# Altium schematic sheet JIG_TEST_FLEX_V1.0.SchDoc
size A2; SheetNumber: 1; SheetTotal: 1
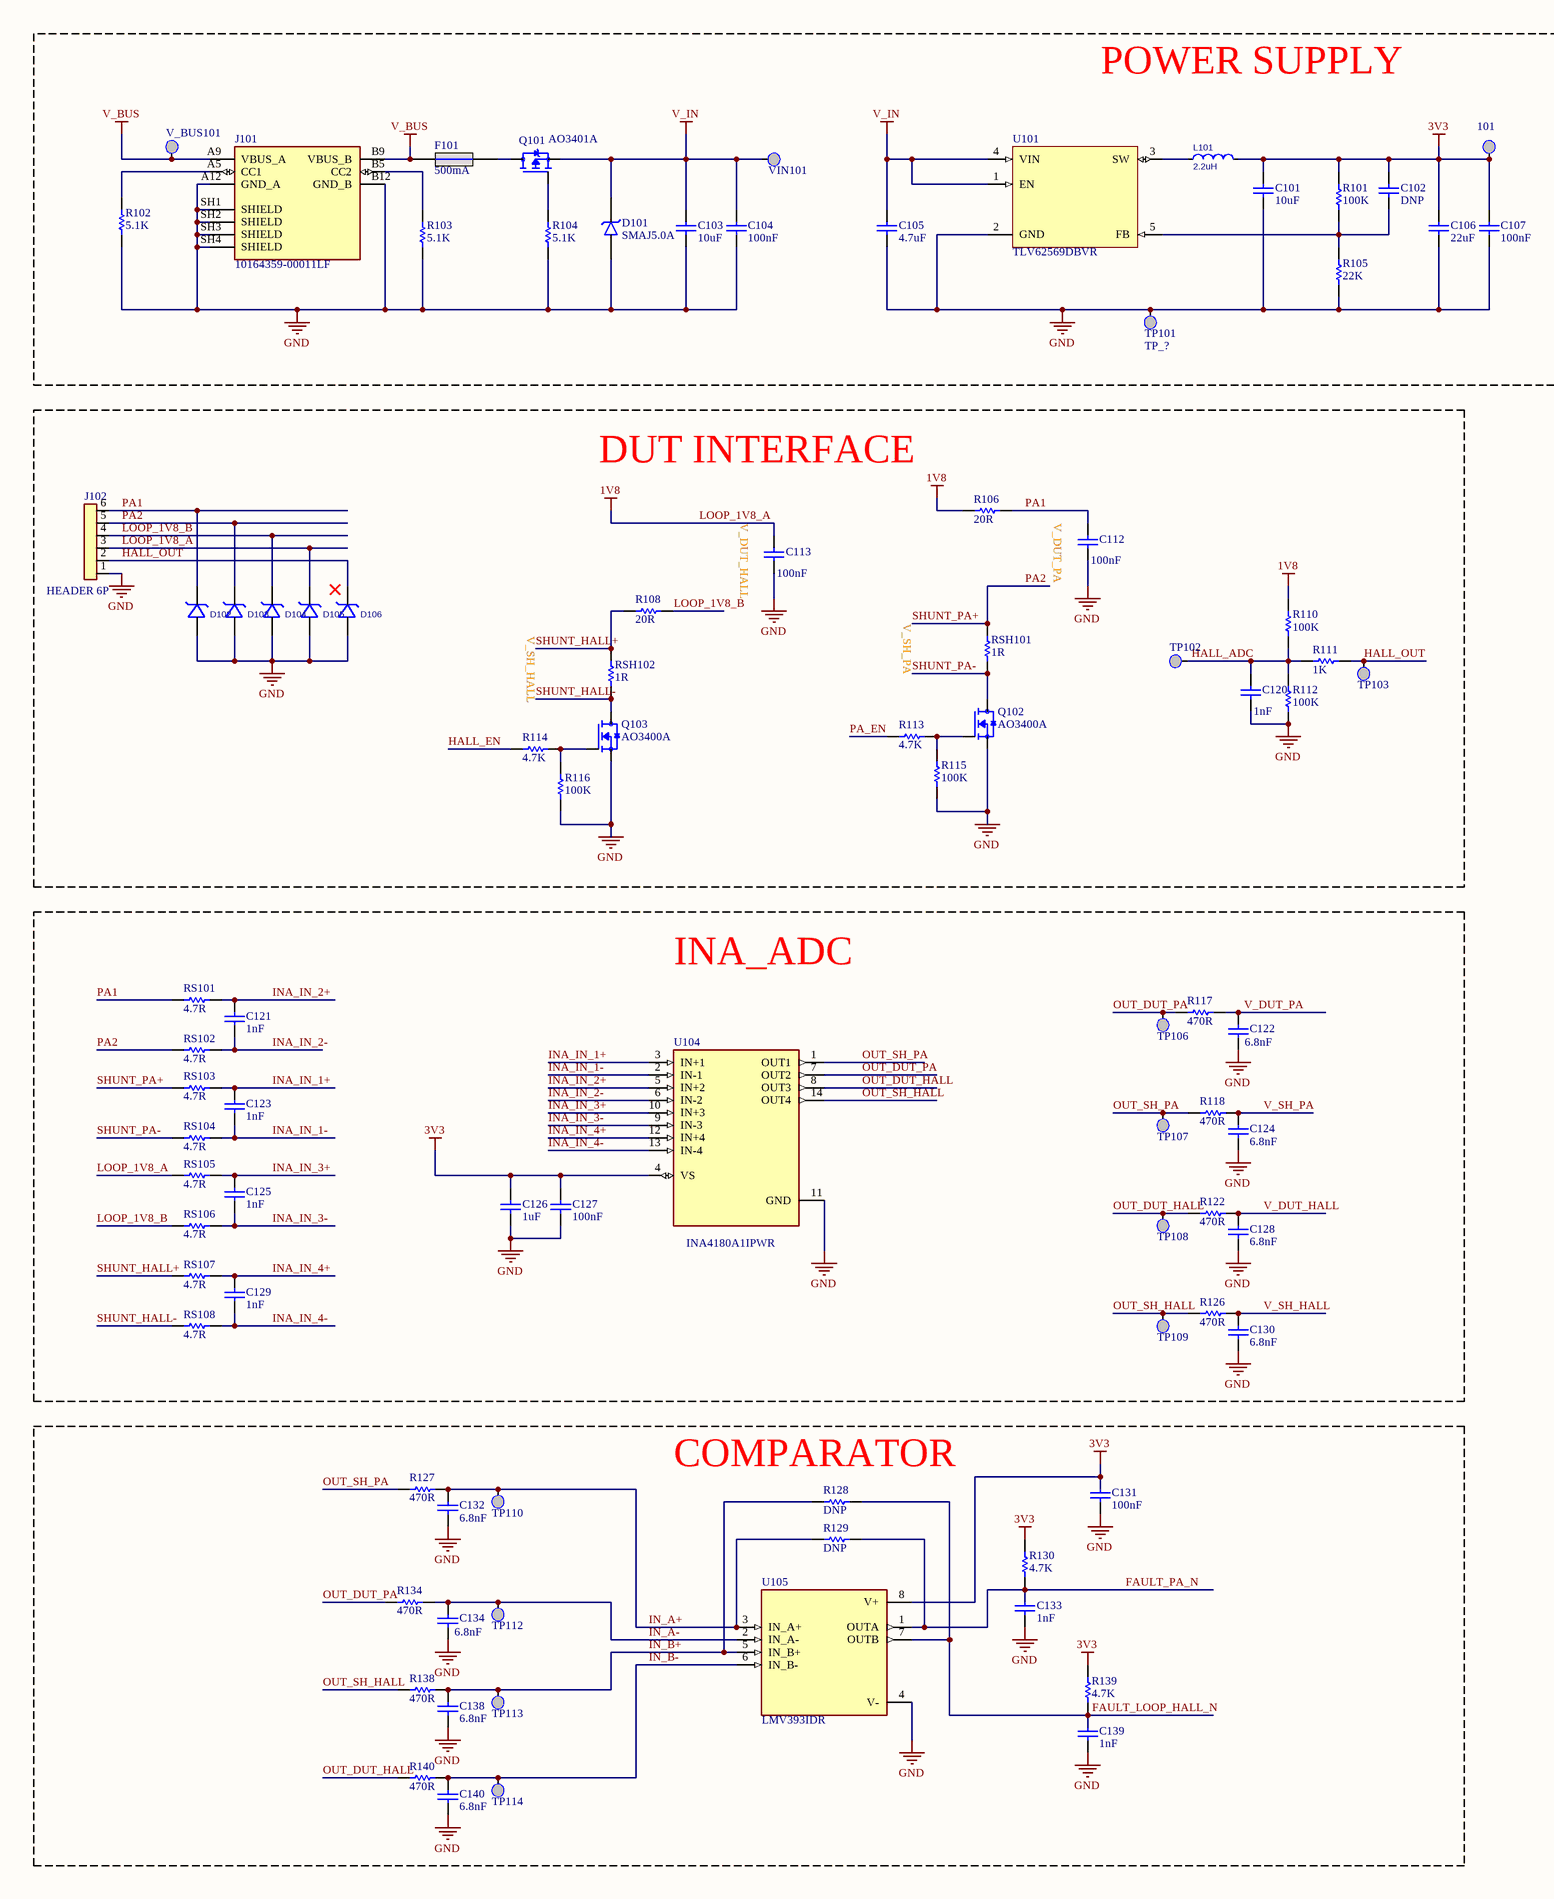
[diagram p0: JIG_TEST_FLEX_V1.0.SchDoc, left]
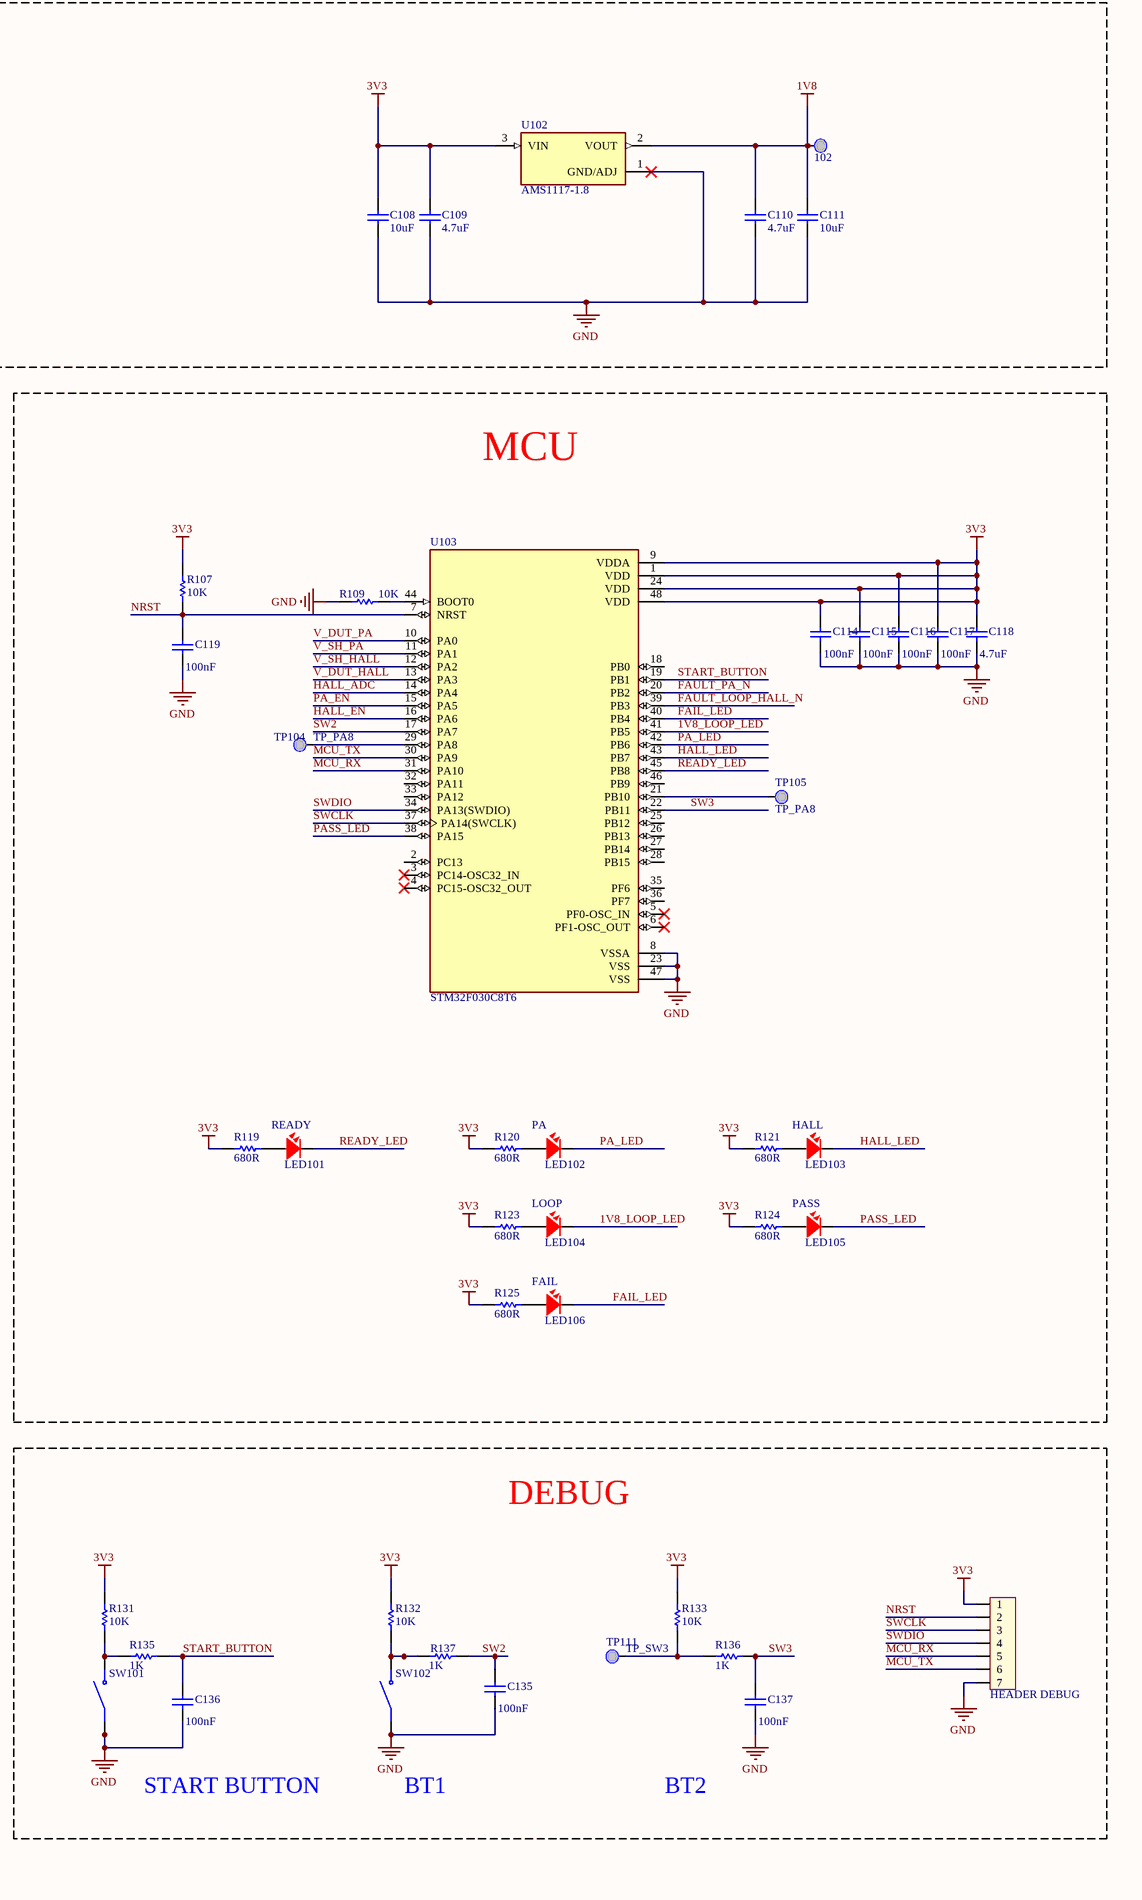
[diagram p1: JIG_TEST_FLEX_V1.0.SchDoc, right]

## Parts
101  TP_?  [TP_SMD_1P50]  (value not drawn)
102  TP_?  [TP_SMD_1P50]  (value not drawn)
C101  10uF  [C0603L]
C102  DNP  [C0402L]
C103  10uF  [C0603L]
C104  100nF  [C0402L]
C105  4.7uF  [C0603L]
C106  22uF  [C0603L]
C107  100nF  [C0402L]
C108  10uF  [C0603L]
C109  4.7uF  [C0603L]
C110  4.7uF  [C0603L]
C111  10uF  [C0603L]
C112  100nF  [C0402L]
C113  100nF  [C0402L]
C114  100nF  [C0402L]
C115  100nF  [C0402L]
C116  100nF  [C0402L]
C117  100nF  [C0402L]
C118  4.7uF  [C0603L]
C119  100nF  [C0402L]
C120  1nF  [C0402L]
C121  1nF  [C0402L]
C122  6.8nF  [C0402L]
C123  1nF  [C0402L]
C124  6.8nF  [C0402L]
C125  1nF  [C0402L]
C126  1uF  [C0402L]
C127  100nF  [C0402L]
C128  6.8nF  [C0402L]
C129  1nF  [C0402L]
C130  6.8nF  [C0402L]
C131  100nF  [C0402L]
C132  6.8nF  [C0402L]
C133  1nF  [C0402L]
C134  6.8nF  [C0402L]
C135  100nF  [C0402L]
C136  100nF  [C0402L]
C137  100nF  [C0402L]
C138  6.8nF  [C0402L]
C139  1nF  [C0402L]
C140  6.8nF  [C0402L]
D101  SMAJ5.0A  [DIOM5026X229N]
D102  PESD5V0U1UA  [SOD-323_L1.8-W1.3-LS2.5-RD]  (value not drawn)
D103  PESD5V0U1UA  [SOD-323_L1.8-W1.3-LS2.5-RD]  (value not drawn)
D104  PESD5V0U1UA  [SOD-323_L1.8-W1.3-LS2.5-RD]  (value not drawn)
D105  PESD5V0U1UA  [SOD-323_L1.8-W1.3-LS2.5-RD]  (value not drawn)
D106  PESD5V0U1UA  [SOD-323_L1.8-W1.3-LS2.5-RD]  (value not drawn)
F101  Value1: 500mA  [R1206Z]  (hidden comment: PTC 500mA 6V)
H101  HEADER DEBUG  [HDR_1X07_P2.54_D1.10]
J101  10164359-00011LF  [AMPHENOL_10164359-00011LF]
J102  HEADER 6P  [61300611121]
L101  2.2uH  [IND-SMD_L4.1-W4.1_PSPMAA0402-1]
LED101  READY  [LED0603_RED]
LED102  PA  [LED0603_RED]
LED103  HALL  [LED0603_RED]
LED104  LOOP  [LED0603_RED]
LED105  PASS  [LED0603_RED]
LED106  FAIL  [LED0603_RED]
Q101  AO3401A  [SOT23-3]
Q102  AO3400A  [SOT95P280X125-3N]
Q103  AO3400A  [SOT95P280X125-3N]
R101  100K  [R0402L1]
R102  5.1K  [R0402L1]
R103  5.1K  [R0402L1]
R104  5.1K  [R0402L1]
R105  22K  [R0402L1]
R106  20R  [R0805]
R107  10K  [R0402L1]
R108  20R  [R0805]
R109  10K  [R0402L1]
R110  100K  [R0402L1]
R111  1K  [R0402L1]
R112  100K  [R0402L1]
R113  4.7K  [R0402L1]
R114  4.7K  [R0402L1]
R115  100K  [R0402L1]
R116  100K  [R0402L1]
R117  470R  [R0402L1]
R118  470R  [R0402L1]
R119  680R  [R0603L]
R120  680R  [R0603L]
R121  680R  [R0603L]
R122  470R  [R0402L1]
R123  680R  [R0603L]
R124  680R  [R0603L]
R125  680R  [R0603L]
R126  470R  [R0402L1]
R127  470R  [R0402L1]
R128  DNP  [R0402L1]
R129  DNP  [R0402L1]
R130  4.7K  [R0402L1]
R131  10K  [R0402L1]
R132  10K  [R0402L1]
R133  10K  [R0402L1]
R134  470R  [R0402L1]
R135  1K  [R0402L1]
R136  1K  [R0402L1]
R137  1K  [R0402L1]
R138  470R  [R0402L1]
R139  4.7K  [R0402L1]
R140  470R  [R0402L1]
RS101  4.7R  [R0603L]
RS102  4.7R  [R0603L]
RS103  4.7R  [R0603L]
RS104  4.7R  [R0603L]
RS105  4.7R  [R0603L]
RS106  4.7R  [R0603L]
RS107  4.7R  [R0603L]
RS108  4.7R  [R0603L]
RSH101  1R  [R1206Z]
RSH102  1R  [R1206Z]
SW101  TS-1187A-B-A-B  [SW_TS-1187A-B-A-B]  (value not drawn)
SW102  TS-1187A-B-A-B  [SW_TS-1187A-B-A-B]  (value not drawn)
TP101  TP_?  [TP_SMD_1P50]
TP102  (no value)  [TP_SMD_1P50]
TP103  (no value)  [TP_SMD_1P50]
TP104  TP_PA8  [TP_SMD_1P50]
TP105  TP_PA8  [TP_SMD_1P50]
TP106  (no value)  [TP_SMD_1P50]
TP107  (no value)  [TP_SMD_1P50]
TP108  (no value)  [TP_SMD_1P50]
TP109  (no value)  [TP_SMD_1P50]
TP110  (no value)  [TP_SMD_1P50]
TP111  TP_SW3  [TP_SMD_1P50]
TP112  (no value)  [TP_SMD_1P50]
TP113  (no value)  [TP_SMD_1P50]
TP114  (no value)  [TP_SMD_1P50]
U101  TLV62569DBVR  [SOT95P280X145-5N]
U102  AMS1117-1.8  [SOT229P700X180-4N]
U103  STM32F030C8T6  [QFP50P900X900X160-48N]
U104  INA4180A1IPWR  [SOP65P640X120-14N]
U105  LMV393IDR  [SOIC127P599X175-8N]
V_BUS101  TP_?  [TP_SMD_1P50]  (value not drawn)
VIN101  TP_?  [TP_SMD_1P50]  (value not drawn)

## Blocks framed on the sheet
POWER SUPPLY: 101 102 C101-C111 D101 F101 J101 L101 Q101 R101-R105 TP101 U101 U102 V_BUS101 VIN101
DUT INTERFACE: C112 C113 C120 D102-D106 J102 Q102 Q103 R106 R108 R110-R116 RSH101 RSH102 TP102 TP103
MCU: C114-C119 LED101-LED106 R107 R109 R119-R121 R123-R125 TP104 TP105 U103
INA_ADC: C121-C130 R117 R118 R122 R126 RS101-RS108 TP106-TP109 U104
COMPARATOR: C131-C134 C138-C140 R127-R130 R134 R138-R140 TP110 TP112-TP114 U105
DEBUG: C135-C137 H101 R131-R133 R135-R137 SW101 SW102 TP111

## Nets
3V3: 101.1(TP) C101.1 C102.1 C106.1 C107.1 C108.1 C109.1 C114.1 C115.1 C116.1 C117.1 C118.1 C126.1 C127.1 C131.1 H101.1 L101.2 R101.1 R107.1 R119.1 R120.1 R121.1 R123.1 R124.1 R125.1 R130.1 R131.1 R132.1 R133.1 R139.1 U102.3(VIN) U103.1(VDD) U103.9(VDDA) U103.24(VDD) U103.48(VDD) U104.4(VS) U105.8(V+)
GND: C101.2 C103.2 C104.2 C105.2 C106.2 C107.2 C108.2 C109.2 C110.2 C111.2 C112.2 C113.2 C114.2 C115.2 C116.2 C117.2 C118.2 C119.2 C120.2 C122.2 C124.2 C126.2 C127.2 C128.2 C130.2 C131.2 C132.2 C133.2 C134.2 C135.2 C136.2 C137.2 C138.2 C139.2 C140.2 D101.2(A) D102.2(A) D103.2(A) D104.2(A) D105.2(A) D106.2(A) H101.7 J101.A12(GND_A) J101.B12(GND_B) J101.SH1(SHIELD) J101.SH2(SHIELD) J101.SH3(SHIELD) J101.SH4(SHIELD) J102.1 Q102.2(S) Q103.2(S) R102.2 R103.2 R104.2 R105.2 R109.1 R112.2 R115.2 R116.2 SW101.A(COM) SW101.B(COM) SW102.A(COM) SW102.B(COM) TP101.1(TP) U101.2(GND) U102.1(GND/ADJ) U103.8(VSSA) U103.23(VSS) U103.47(VSS) U104.11(GND) U105.4(V-)
LOOP_1V8_A: 102.1(TP) C110.1 C111.1 C113.1 D105.1(C) J102.3 R106.1 R110.1 RS105.2 U102.2(VOUT)  [also labelled 1V8]
V_BUS: F101.1 J101.A9(VBUS_A) J101.B9(VBUS_B) V_BUS101.1(TP)
V_IN: C103.1 C104.1 C105.1 D101.1(K) Q101.2(S) U101.1(EN) U101.4(VIN) VIN101.1(TP)
1V8_LOOP_LED: LED104.2 U103.41(PB5)
FAIL_LED: LED106.2 U103.40(PB4)
FAULT_LOOP_HALL_N: C139.1 R128.2 R139.2 U103.39(PB3) U105.7(OUTB)
FAULT_PA_N: C133.1 R129.2 R130.2 U103.20(PB2) U105.1(OUTA)
HALL_ADC: C120.1 R110.2 R111.1 R112.1 TP102.1(TP) U103.14(PA4)
HALL_EN: R114.2 U103.16(PA6)
HALL_LED: LED103.2 U103.43(PB7)
HALL_OUT: D106.1(C) J102.2 R111.2 TP103.1(TP)
IN_A+: C132.1 R127.1 R129.1 TP110.1(TP) U105.3(IN_A+)
IN_A-: C134.1 R134.1 TP112.1(TP) U105.2(IN_A-)
IN_B+: C138.1 R128.1 R138.1 TP113.1(TP) U105.5(IN_B+)
IN_B-: C140.1 R140.1 TP114.1(TP) U105.6(IN_B-)
INA_IN_1+: C123.1 RS103.1 U104.3(IN+1)
INA_IN_1-: C123.2 RS104.1 U104.2(IN-1)
INA_IN_2+: C121.1 RS101.1 U104.5(IN+2)
INA_IN_2-: C121.2 RS102.1 U104.6(IN-2)
INA_IN_3+: C125.1 RS105.1 U104.10(IN+3)
INA_IN_3-: C125.2 RS106.1 U104.9(IN-3)
INA_IN_4+: C129.1 RS107.1 U104.12(IN+4)
INA_IN_4-: C129.2 RS108.1 U104.13(IN-4)
LOOP_1V8_B: D104.1(C) J102.4 R108.2 RS106.2
MCU_RX: H101.5 U103.31(PA10)
MCU_TX: H101.6 U103.30(PA9)
NRST: C119.1 H101.2 R107.2 U103.7(NRST)
OUT_DUT_HALL: R122.2 R140.2 TP108.1(TP) U104.8(OUT3)
OUT_DUT_PA: R117.2 R134.2 TP106.1(TP) U104.7(OUT2)
OUT_SH_HALL: R126.2 R138.2 TP109.1(TP) U104.14(OUT4)
OUT_SH_PA: R118.2 R127.2 TP107.1(TP) U104.1(OUT1)
PA1: C112.1 D102.1(C) J102.6 R106.2 RS101.2
PA2: D103.1(C) J102.5 RS102.2 RS103.2 RSH101.2  [also labelled SHUNT_PA+]
PA_EN: R113.2 U103.15(PA5)
PA_LED: LED102.2 U103.42(PB6)
PASS_LED: LED105.2 U103.38(PA15)
READY_LED: LED101.2 U103.45(PB8)
SHUNT_HALL+: R108.1 RS107.2 RSH102.2
SHUNT_HALL-: Q103.3(D) RS108.2 RSH102.1
SHUNT_PA-: Q102.3(D) RS104.2 RSH101.1
START_BUTTON: C136.1 R135.2 U103.19(PB1)
SW2: C135.1 R137.2 U103.17(PA7)
SW3: C137.1 R136.2 U103.22(PB11)
SWCLK: H101.3 U103.37(PA14(SWCLK))
SWDIO: H101.4 U103.34(PA13(SWDIO))
V_DUT_HALL: C128.1 R122.1 U103.13(PA3)
V_DUT_PA: C122.1 R117.1 U103.10(PA0)
V_SH_HALL: C130.1 R126.1 U103.12(PA2)
V_SH_PA: C124.1 R118.1 U103.11(PA1)
NetC102_2: C102.2 R101.2 R105.1 U101.5(FB)
NetF101_2: F101.2 Q101.3(D)
NetJ101_A5: J101.A5(CC1) R102.1
NetJ101_B5: J101.B5(CC2) R103.1
NetL101_1: L101.1 U101.3(SW)
NetLED101_1: LED101.1 R119.2
NetLED102_1: LED102.1 R120.2
NetLED103_1: LED103.1 R121.2
NetLED104_1: LED104.1 R123.2
NetLED105_1: LED105.1 R124.2
NetLED106_1: LED106.1 R125.2
NetQ101_1: Q101.1(G) R104.1
NetQ102_1: Q102.1(G) R113.1 R115.1
NetQ103_1: Q103.1(G) R114.1 R116.1
NetR109_2: R109.2 U103.44(BOOT0)
NetR131_2: R131.2 R135.1 SW101.C(NO) SW101.D(NO)
NetR132_2: R132.2 R137.1 SW102.C(NO) SW102.D(NO)
NetR133_2: R133.2 R136.1 TP111.1(TP)
NetTP104_1: TP104.1(TP) U103.29(PA8)
NetTP105_1: TP105.1(TP) U103.21(PB10)

Not connected (* = marked no-connect by the designer): U103 2(PC13) 3(PC14-OSC32_IN)* 4(PC15-OSC32_OUT)* 5(PF0-OSC_IN)* 6(PF1-OSC_OUT)* 18(PB0) 25(PB12) 26(PB13) 27(PB14) 28(PB15) 32(PA11) 33(PA12) 35(PF6) 36(PF7) 46(PB9)

## Notes on the sheet
- (near C113) V_DUT_HALL
- (near C112) V_DUT_PA
- V_SH_HALL
- V_SH_PA
- START BUTTON
- BT1
- BT2

## Library data of the parts
101 102 TP101-TP114 V_BUS101 VIN101 = TEST_POINT: TP SMD 1P PadDia_1.50mm ROUND COPPER TEST POINT
C101 C103 C108 C111 = C0402: CAP 0402 MLCC NON-POLARIZED GENERIC; VALUE TOLERANCE VOLTAGE AND MPN SET ON INSTANCE; MPN: CL10A106KP8NNNC; Manu: Samsung Electro-Mechanics; Tolerance: 10%; Type: Capacitor; Value2: 10V; Value1: 10uF; Case: 0603; Manufacturer: Samsung Electro-Mechanics; JLCPCB Part #: C19702; LCSC Part #: C19702
C102 = C0402: CAP 0402 MLCC NON-POLARIZED GENERIC; VALUE TOLERANCE VOLTAGE AND MPN SET ON INSTANCE; MPN: HGC0402R5226M100NTEJ; Manu: Chinocera; Tolerance: 20%; Value1: 22uF; Type: Capacitor; Value2: 10V; Case: 0402; JLCPCB Part #: C22367823; LCSC Part #: C22367823; Manufacturer: Chinocera
C104 C107 = C0402: CAP 0402 MLCC NON-POLARIZED GENERIC; VALUE TOLERANCE VOLTAGE AND MPN SET ON INSTANCE; MPN: CL05B104KB54PNC; Manu: Samsung Electro-Mechanics; Tolerance: 10%; Type: Capacitor; Value2: 50V; Value1: 100nF; Case: 0402; JLCPCB Part #: C307331; LCSC Part #: C307331; Manufacturer: Samsung Electro-Mechanics
C105 C109 C110 = C0402: CAP 0402 MLCC NON-POLARIZED GENERIC; VALUE TOLERANCE VOLTAGE AND MPN SET ON INSTANCE; MPN: CL10A475KO8NNNC; Manu: Samsung Electro-Mechanics; Tolerance: 10%; Type: Capacitor; Value2: 16V; Value1: 4.7uF; Case: 0603; JLCPCB Part #: C19666; LCSC Part #: C19666; Manufacturer: Samsung Electro-Mechanics
C106 = C0402: CAP 0402 MLCC NON-POLARIZED GENERIC; VALUE TOLERANCE VOLTAGE AND MPN SET ON INSTANCE; MPN: CL10A226MQ8NRNC; Manu: Samsung Electro-Mechanics; Tolerance: 20%; Type: Capacitor; Value2: 6.3V; Value1: 22uF; Case: 0603; JLCPCB Part #: C59461; LCSC Part #: C59461; Manufacturer: Samsung Electro-Mechanics
C112-C117 C119 C127 C131 C135-C137 = C0402: CAP 0402 MLCC NON-POLARIZED GENERIC; VALUE TOLERANCE VOLTAGE AND MPN SET ON INSTANCE; MPN: CL05B104KO5NNNC; Manu: Samsung Electro-Mechanics; Tolerance: 10%; Type: Capacitor; Value2: 16V; Dielectric: X7R; Value1: 100nF; Case: 0402; JLCPCB Part #: C1525; LCSC Part #: C1525; Manufacturer: Samsung Electro-Mechanics; Manufacturer Part Number: CL05B104KO5NNNC; Package: 0402; Voltage Rating: 16V
C118 = C0402: CAP 0402 MLCC NON-POLARIZED GENERIC; VALUE TOLERANCE VOLTAGE AND MPN SET ON INSTANCE; MPN: CL10A475KO8NNNC; Manu: Samsung Electro-Mechanics; Tolerance: 10%; Type: Capacitor; Value2: 16V; Dielectric: X5R; Value1: 4.7uF; Case: 0603; JLCPCB Part #: C19666; LCSC Part #: C19666; Manufacturer: Samsung Electro-Mechanics; Manufacturer Part Number: CL10A475KO8NNNC; Package: 0603; Voltage Rating: 16V
C120 C121 C123 C125 C129 C133 C139 = C0402: CAP 0402 MLCC NON-POLARIZED GENERIC; VALUE TOLERANCE VOLTAGE AND MPN SET ON INSTANCE; MPN: 0402CG102J500NT; Manu: FH; Tolerance: 5%; Type: Capacitor; Value2: 50V; Dielectric: C0G; Value1: 1nF; Case: 0402; JLCPCB Part #: C53547; LCSC Part #: C53547; Manufacturer: FH; Manufacturer Part Number: 0402CG102J500NT; Package: 0402; Voltage Rating: 50V
C122 C124 C128 C130 C132 C134 C138 C140 = C0402: CAP 0402 MLCC NON-POLARIZED GENERIC; VALUE TOLERANCE VOLTAGE AND MPN SET ON INSTANCE; MPN: 0402B682K500NT; Manu: FH (Guangdong Fenghua Advanced Tech); Tolerance: 10%; Type: Capacitor; Value2: 50V; Dielectric: X7R; Value1: 6.8nF; Case: 0402; JLCPCB Part #: C1542; LCSC Part #: C1542; Manufacturer: FH (Guangdong Fenghua Advanced Tech); Manufacturer Part Number: 0402B682K500NT; Package: 0402; Voltage Rating: 50V
C126 = C0402: CAP 0402 MLCC NON-POLARIZED GENERIC; VALUE TOLERANCE VOLTAGE AND MPN SET ON INSTANCE; MPN: CL05A105KA5NQNC; Manu: Samsung Electro-Mechanics; Tolerance: 10%; Type: Capacitor; Value2: 25V; Dielectric: X5R; Value1: 1uF; Case: 0402; JLCPCB Part #: C52923; LCSC Part #: C52923; Manufacturer: Samsung Electro-Mechanics; Manufacturer Part Number: CL05A105KA5NQNC; Package: 0402; Voltage Rating: 25V
D101 = SMAJ5.0A: TVS SMA/DO-214AC Vrwm_5V Ppk_400W@10/1000us UNIDIRECTIONAL SMAJ5.0A; MF: Liown; Value1: Vrwm 5V; Value2: Ppp 400W, 10/1000us; SnapEDA_Link: https://www.snapeda.com/parts/SMAJ5.0A/Bourns/view-part/?ref=snap; Package: DO-214AC; Value: *; MP: SMAJ5.0A; Check_prices: https://jlcpcb.com/partdetail/Liown-SMAJ50A/C2925443; MPN: SMAJ5.0A; Manu: Liown; JLCPCB Part #: C2925443; Case: DO-214AC; Type: TVS
D102-D106 = PESD5V0U1UA: TVS SOD-323 ESD PROTECTION PESD5V0U1UA; Manufacturer: TECH PUBLIC; Symbol: PESD5V0U1UA_C19829579; AddInBom: yes; ModelId: 533ebfb2f206414f9035ed0ccba1097dÂŽ0819f05c4eef4c71ace90d822a990e87; ModelTransform: 104.3305,51.181,0,0,0,0,0,-0.004,0; Reverse Stand-Off Voltage (Vrwm): 5V; Clamping Voltage: 10V；14V; Peak Pulse Current (Ipp): 4A@8/20us; Peak Pulse Power Dissipation (Ppp): 65W@8/20us; Voltage - Breakdown: 7.5V; Reverse Leakage Current (Ir): 80nA; level of protection: IEC 61000-4-5；IEC 61000-4-2; Junction Capacitance: 0.5pF; Value1: Vrwm 5V; Value2: Ipp 4A, 8/20us; Device: PESD5V0U1UA; LCSC Part Name: 5V截止 峰值浪涌电流：4A@8/20us; SupplierPart: C19829579; ManufacturerPart: PESD5V0U1UA; Supplier Footprint: SOD-323; JLCPCB Part Class: Extended Part; Datasheet: https://www.lcsc.com/datasheet/C19829579.pdf; Supplier: LCSC; ConvertToPcb: yes; FootprintName: SOD-323_L1.8-W1.3-LS2.5-RD; ModelName: SOD-323_L1.8-W1.3-LS2.5-RD; MPN: PESD5V0U1UA; Manu: TECH PUBLIC; JLCPCB Part #: C19829579; Case: SOD-323; Type: TVS
F101 = nSMD050: FUSE 1206 PTC RESETTABLE nSMD050; Manu: TECHFUSE; Case: 1206; MPN: nSMD050; Value2: 6V; Type: Fuse; JLCPCB Part #: C69688; LCSC Part #: C69688; Manufacturer: TECHFUSE; Manufacturer Part Number: nSMD050; Package: 1206
H101 = Header 7P 2.54 Duc Thang: CON THT 7P Pitch_2.54mm SINGLE-ROW; MPN UNVERIFIED; Ten_Linh_Kien: Header 7P XH2.54-7P Đực Thẳng; Ma_Hang: MH003369; Chung_Loai: Cắm; Value1: Male Header 1x7; Value2: Pitch 2.54mm; Don_Vi: Con; Case: THT-1x7-P2.54mm; Type: Connector
J101 = 10164359-00011LF: CON SMD 6P USB TYPE-C RECEPTACLE SINGLE-ROW 10164359-00011LF; MF: Amphenol ICC; Value1: USB Type-C 6P; Value2: 3A; SnapEDA_Link: https://www.snapeda.com/parts/1016435900011LF/Amphenol/view-part/?ref=snap; Package: USB-C-6P-SMD; Value: *; MP: 10164359-00011LF; Check_prices: https://www.snapeda.com/parts/1016435900011LF/Amphenol/view-part/?ref=eda; JLCPCB Part #: C5407555; LCSC Part #: C5407555; MPN: 10164359-00011LF; Manufacturer: Amphenol ICC; Manufacturer Part Number: 10164359-00011LF; Manu: Amphenol ICC; Case: USB-C-6P-SMD; Type: Connector
J102 = 6130XX11121_61300611121: CON THT 6P 3A 250VAC Pitch_2.54mm SINGLE-ROW PIN HEADER; MF: Wurth Elektronik; Value1: Male Header 1x6; Value2: Pitch 2.54mm; Package: THT-1x6-P2.54mm; Price: None; Value: *; MP: 61300611121; Availability: Check JLC stock at order; MPN: 61300611121; Manu: Wurth Elektronik; Case: THT-1x6-P2.54mm; Type: Connector
L101 = PSPMAA0402-2R2M-ANP: IND SMD 2.2uH +/-20% Irms_3A Isat_5A DCRmax_58mOhm MOLDED POWER; Manufacturer: PROD Tech; AddInBom: yes; Tolerance: ±20%; Current Rating: 3A; Current - Saturation(Isat): 5A; DC Resistance(DCR): 58 mOhm max; Value2: Irated 3A, Isat 5A; Type: Inductor; Symbol: PSPMAA0402-2R2M-ANP; Device: PSPMAA0402-2R2M-ANP; LCSC Part Name: 2.2uH +/-20%, 3A Irms, 5A Isat; SupplierPart: C436515; ManufacturerPart: PSPMAA0402-2R2M-ANP; Supplier Footprint: SMD,4.5x4.1mm; JLCPCB Part Class: Extended Part; Datasheet: https://static.chipdip.ru/lib/612/DOC042612369.pdf; Supplier: LCSC; ConvertToPcb: yes; FootprintName: IND-SMD_L4.1-W4.1_PSPMAA0402-1; Value: 2.2uH; MPN: PSPMAA0402-2R2M-ANP; Manu: PROD Tech; JLCPCB Part #: C436515; Case: SMD 4.5x4.1mm; Value1: 2.2uH
LED101 = LED RED 0603: LED 0603; COLOR AND MPN UNRESOLVED; MPN: KT-0603R; Comment Description: READY LED RED 0603; Value1: LED RED; Value2: 5mA; Manu: Hubei KENTO Elec; Case: 0603; Type: LED; JLCPCB Part #: C2286; LCSC Part #: C2286; Manufacturer: Hubei KENTO Elec; Manufacturer Part Number: KT-0603R; Package: 0603
LED102 = LED RED 0603: LED 0603; COLOR AND MPN UNRESOLVED; MPN: KT-0603R; Comment Description: PA LED RED 0603; Value1: LED RED; Value2: 5mA; Manu: Hubei KENTO Elec; Case: 0603; Type: LED; JLCPCB Part #: C2286; LCSC Part #: C2286; Manufacturer: Hubei KENTO Elec; Manufacturer Part Number: KT-0603R; Package: 0603
LED103 = LED RED 0603: LED 0603; COLOR AND MPN UNRESOLVED; MPN: KT-0603R; Comment Description: HALL LED RED 0603; Value1: LED RED; Value2: 5mA; Manu: Hubei KENTO Elec; Case: 0603; Type: LED; JLCPCB Part #: C2286; LCSC Part #: C2286; Manufacturer: Hubei KENTO Elec; Manufacturer Part Number: KT-0603R; Package: 0603
LED104 = LED RED 0603: LED 0603; COLOR AND MPN UNRESOLVED; MPN: KT-0603R; Comment Description: LOOP LED RED 0603; Value1: LED RED; Value2: 5mA; Manu: Hubei KENTO Elec; Case: 0603; Type: LED; JLCPCB Part #: C2286; LCSC Part #: C2286; Manufacturer: Hubei KENTO Elec; Manufacturer Part Number: KT-0603R; Package: 0603
LED105 = LED RED 0603: LED 0603; COLOR AND MPN UNRESOLVED; MPN: KT-0603R; Comment Description: PASS LED RED 0603; Value1: LED RED; Value2: 5mA; Manu: Hubei KENTO Elec; Case: 0603; Type: LED; JLCPCB Part #: C2286; LCSC Part #: C2286; Manufacturer: Hubei KENTO Elec; Manufacturer Part Number: KT-0603R; Package: 0603
LED106 = LED RED 0603: LED 0603; COLOR AND MPN UNRESOLVED; MPN: KT-0603R; Comment Description: FAIL LED RED 0603; Value1: LED RED; Value2: 5mA; Manu: Hubei KENTO Elec; Case: 0603; Type: LED; JLCPCB Part #: C2286; LCSC Part #: C2286; Manufacturer: Hubei KENTO Elec; Manufacturer Part Number: KT-0603R; Package: 0603
Q101 = AO3401A: P-MOS SOT-23 Vds_-30V IdMax_-4A@TA25C AO3401A; MF: Alpha & Omega Semicon; Value1: P-Channel; Value2: Vds -30V; Type: MOSFET; SnapEDA_Link: https://www.snapeda.com/parts/AO3401A/Alpha/view-part/?ref=snap; Package: SOT-23; Value: *; MP: AO3401A; Check_prices: https://www.snapeda.com/parts/AO3401A/Alpha/view-part/?ref=eda; JLCPCB Part #: C15127; LCSC Part #: C15127; MPN: AO3401A; Manufacturer: Alpha & Omega Semicon; Manufacturer Part Number: AO3401A; Manu: Alpha & Omega Semicon; Case: SOT-23
Q102 Q103 = AO3400A: N-MOS SOT-23 Vds_30V IdMax_5.7A@TA25C AO3400A; MF: Alpha & Omega Semicon; Value1: N-Channel; Value2: Vds 30V; Type: MOSFET; SnapEDA_Link: https://www.snapeda.com/parts/AO3400A/Alpha/view-part/?ref=snap; Package: SOT-23; Value: *; MP: AO3400A; Check_prices: https://www.snapeda.com/parts/AO3400A/Alpha/view-part/?ref=eda; JLCPCB Part #: C20917; LCSC Part #: C20917; MPN: AO3400A; Manufacturer: Alpha & Omega Semicon; Manufacturer Part Number: AO3400A; Manu: Alpha & Omega Semicon; Case: SOT-23
R101 R110 R112 R115 R116 = R0402_4: RES 0402 GENERIC; VALUE TOLERANCE POWER AND MPN SET ON INSTANCE; MPN: 0402WGF1003TCE; Value2: 62.5mW; Comment Description: RES 100K +/-1% 62.5mW 0402; Manu: UNI-ROYAL(Uniroyal Elec); Tolerance: 1%; Value1: 100K; Case: 0402; Type: Resistor; JLCPCB Part #: C25741; LCSC Part #: C25741; Manufacturer: UNI-ROYAL(Uniroyal Elec); Manufacturer Part Number: 0402WGF1003TCE; Package: 0402
R102-R104 = R0402_4: RES 0402 GENERIC; VALUE TOLERANCE POWER AND MPN SET ON INSTANCE; MPN: 0402WGF5101TCE; Value2: 62.5mW; Comment Description: RES 5.1K +/-1% 62.5mW 0402; Manu: UNI-ROYAL(Uniroyal Elec); Tolerance: 1%; Value1: 5.1K; Case: 0402; Type: Resistor; JLCPCB Part #: C25905; LCSC Part #: C25905; Manufacturer: UNI-ROYAL(Uniroyal Elec); Manufacturer Part Number: 0402WGF5101TCE; Package: 0402
R105 = R0402_4: RES 0402 GENERIC; VALUE TOLERANCE POWER AND MPN SET ON INSTANCE; MPN: 0402WGF2202TCE; Value2: 62.5mW; Comment Description: RES 22K +/-1% 62.5mW 0402; Manu: UNI-ROYAL(Uniroyal Elec); Tolerance: 1%; Value1: 22K; Case: 0402; Type: Resistor; JLCPCB Part #: C25768; LCSC Part #: C25768; Manufacturer: UNI-ROYAL(Uniroyal Elec); Manufacturer Part Number: 0402WGF2202TCE; Package: 0402
R106 R108 = R0805: RES 0805 GENERIC; VALUE TOLERANCE POWER AND MPN SET ON INSTANCE; MPN: CRCW080520R0FKEAHP; Value2: 500mW; Comment Description: RES 20R +/-1% 500mW 0805; Manu: Vishay Intertech; Tolerance: 1%; Value1: 20R; Case: 0805; Type: Resistor; JLCPCB Part #: C313859; LCSC Part #: C313859; Manufacturer: Vishay Intertech; Manufacturer Part Number: CRCW080520R0FKEAHP; Package: 0805
R107 R109 R131-R133 = R0402_4: RES 0402 GENERIC; VALUE TOLERANCE POWER AND MPN SET ON INSTANCE; MPN: 0402WGF1002TCE; Value2: 62.5mW; Comment Description: RES 10K +/-1% 62.5mW 0402; Manu: UNI-ROYAL(Uniroyal Elec); Tolerance: 1%; Value1: 10K; Case: 0402; Type: Resistor; JLCPCB Part #: C25744; LCSC Part #: C25744; Manufacturer: UNI-ROYAL(Uniroyal Elec); Manufacturer Part Number: 0402WGF1002TCE; Package: 0402
R111 R135-R137 = R0402_4: RES 0402 GENERIC; VALUE TOLERANCE POWER AND MPN SET ON INSTANCE; MPN: 0402WGF1001TCE; Value2: 62.5mW; Comment Description: RES 1K +/-1% 62.5mW 0402; Manu: UNI-ROYAL(Uniroyal Elec); Tolerance: 1%; Value1: 1K; Case: 0402; Type: Resistor; JLCPCB Part #: C11702; LCSC Part #: C11702; Manufacturer: UNI-ROYAL(Uniroyal Elec); Manufacturer Part Number: 0402WGF1001TCE; Package: 0402
R113 R114 = R0402_4: RES 0402 GENERIC; VALUE TOLERANCE POWER AND MPN SET ON INSTANCE; MPN: 0402WGF4701TCE; Value2: 62.5mW; Comment Description: RES 4.7K +/-1% 62.5mW 0402; Manu: UNI-ROYAL(Uniroyal Elec); Tolerance: 1%; Value1: 4.7K; Case: 0402; Type: Resistor; JLCPCB Part #: C25900; LCSC Part #: C25900; Manufacturer: UNI-ROYAL(Uniroyal Elec); Manufacturer Part Number: 0402WGF4701TCE; Package: 0402
R117 R118 R122 R126 R127 R134 R138 R140 = R0402_4: RES 0402 GENERIC; VALUE TOLERANCE POWER AND MPN SET ON INSTANCE; MPN: 0402WGF4700TCE; Value2: 62.5mW; Comment Description: RES 100R +/-1% 62.5mW 0402; Manu: UNI-ROYAL(Uniroyal Elec); Tolerance: 1%; Value1: 470R; Case: 0402; Type: Resistor; JLCPCB Part #: C25117; LCSC Part #: C25117; Manufacturer: UNI-ROYAL(Uniroyal Elec); Manufacturer Part Number: 0402WGF4700TCE; Package: 0402
R119-R121 R123-R125 = R0402_4: RES 0402 GENERIC; VALUE TOLERANCE POWER AND MPN SET ON INSTANCE; MPN: 0603WAF6800T5E; Value2: 100mW; Comment Description: RES 680R +/-1% 100mW 0603; Manu: UNI-ROYAL(Uniroyal Elec); Tolerance: 1%; Value1: 680R; Case: 0603; Type: Resistor; JLCPCB Part #: C23228; LCSC Part #: C23228; Manufacturer: UNI-ROYAL(Uniroyal Elec); Manufacturer Part Number: 0603WAF6800T5E; Package: 0603
R128 R129 = R0402_4: RES 0402 GENERIC; VALUE TOLERANCE POWER AND MPN SET ON INSTANCE; MPN: 0402WGF4701TCE; Value1: 4.7K; Value2: 62.5mW; Comment Description: RES 4.7K +/-1% 62.5mW 0402 - DNP; Manu: UNI-ROYAL(Uniroyal Elec); Tolerance: 1%; Case: 0402; Type: Resistor; JLCPCB Part #: C25900; LCSC Part #: C25900; Manufacturer: UNI-ROYAL(Uniroyal Elec); Manufacturer Part Number: 0402WGF4701TCE; Package: 0402
R130 R139 = R0402_4: RES 0402 GENERIC; VALUE TOLERANCE POWER AND MPN SET ON INSTANCE; MPN: 0402WGF4701TCE; Value2: 62.5mW; Comment Description: RES 100R +/-1% 62.5mW 0402; Manu: UNI-ROYAL(Uniroyal Elec); Tolerance: 1%; Value1: 4.7K; Case: 0402; Type: Resistor; JLCPCB Part #: C25900; LCSC Part #: C25900; Manufacturer: UNI-ROYAL(Uniroyal Elec); Manufacturer Part Number: 0402WGF4701TCE; Package: 0402
RS101-RS108 = R0402_4: RES 0402 GENERIC; VALUE TOLERANCE POWER AND MPN SET ON INSTANCE; MPN: 0402WGF470KTCE; Value2: 62.5mW; Comment Description: RES 4.7R +/-1% 62.5mW 0402; Manu: UNI-ROYAL(Uniroyal Elec); Tolerance: 1%; Value1: 4.7R; Case: 0402; Type: Resistor; JLCPCB Part #: C25121; LCSC Part #: C25121; Manufacturer: UNI-ROYAL(Uniroyal Elec); Manufacturer Part Number: 0402WGF470KTCE; Package: 0402
RSH101 RSH102 = R0402_4: RES 0402 GENERIC; VALUE TOLERANCE POWER AND MPN SET ON INSTANCE; MPN: CSR1206FT1R00; Value2: 500mW; Comment Description: RES 1R +/-1% 62.5mW 0402; Manu: SEI(Stackpole Elec); Tolerance: 1%; Value1: 1R; Case: 1206; Type: Resistor; JLCPCB Part #: C346800; LCSC Part #: C346800; Manufacturer: SEI(Stackpole Elec); Manufacturer Part Number: CSR1206FT1R00; Package: 1206
SW101 SW102 = TS-1187A-B-A-B: SW SMD TACTILE TS-1187A-B-A-B; MF: XKB Connection; Value1: SPST Tactile; Value2: 50mA, 12V; MP: TS-1187A-B-A-B; Value: *; Price: None; Package: SMD-4P-5.1x5.1mm; Availability: Check JLC stock at order; JLCPCB Part #: C318884; LCSC Part #: C318884; MPN: TS-1187A-B-A-B; Manufacturer: XKB Connection; Manufacturer Part Number: TS-1187A-B-A-B; Manu: XKB Connection; Case: SMD-4P-5.1x5.1mm; Type: Switch
U101 = TLV62569DBVR: IC SOT-23-5 2A Vin_2.5-5.5V SYNCHRONOUS BUCK CONVERTER TLV62569DBVR; MF: Texas Instruments; Value1: Adjustable Buck; Value2: Iout 2A, Vin 2.5-5.5V; SnapEDA_Link: https://www.snapeda.com/parts/TLV62569DBVR/Texas+Instruments/view-part/?ref=snap; Package: SOT-23-5; Value: *; MP: TLV62569DBVR; Check_prices: https://www.snapeda.com/parts/TLV62569DBVR/Texas+Instruments/view-part/?ref=eda; Parameter 1: *; MPN: TLV62569DBVR; Manu: Texas Instruments; JLCPCB Part #: C141836; Case: SOT-23-5; Type: DC-DC Converter
U102 = AMS1117-1.8: IC SOT-223 LDO AMS1117-1.8; MANUFACTURER UNVERIFIED; MF: Advanced Monolithic Systems; Value1: Vout 1.8V; Value2: Iout 1A; Package: SOT-223; Price: None; Value: *; MP: AMS1117-1.8; Availability: Check JLC stock at order; MPN: AMS1117-1.8; Manu: Advanced Monolithic Systems; JLCPCB Part #: C6185; Case: SOT-223; Type: LDO
U103 = STM32F030C8T6: IC LQFP-48 48MHz 64KB-FLASH 8KB-SRAM ARM CORTEX-M0 MCU STM32F030C8T6; MF: STMicroelectronics; Value2: 48MHz, Flash 64KB; SnapEDA_Link: https://www.snapeda.com/parts/STM32F030C8T6/STMicroelectronics/view-part/?ref=snap; Package: LQFP-48; Value: *; MP: STM32F030C8T6; Check_prices: https://www.snapeda.com/parts/STM32F030C8T6/STMicroelectronics/view-part/?ref=eda; JLCPCB Part #: C23922; LCSC Part #: C23922; Manufacturer: STMicroelectronics; Manufacturer Part Number: STM32F030C8T6; MPN: STM32F030C8T6; Manu: STMicroelectronics; Case: LQFP-48; Value1: ARM Cortex-M0; Type: MCU
U104 = INA4180A1IPWR: IC TSSOP-14 GAIN_20V/V QUAD CURRENT-SENSE AMPLIFIER INA4180A1IPWR; MF: Texas Instruments; Value1: Gain 20V/V; Value2: 4 channels; SnapEDA_Link: https://www.snapeda.com/parts/INA4180A1IPWR/Texas+Instruments/view-part/?ref=snap; Package: TSSOP-14; Value: *; MP: INA4180A1IPWR; Check_prices: https://www.snapeda.com/parts/INA4180A1IPWR/Texas+Instruments/view-part/?ref=eda; JLCPCB Part #: C2057528; LCSC Part #: C2057528; Manufacturer: Texas Instruments; Manufacturer Part Number: INA4180A1IPWR; MPN: INA4180A1IPWR; Manu: Texas Instruments; Case: TSSOP-14; Type: Current Sense Amplifier
U105 = LMV393IDR: IC SOIC-8 DUAL OPEN-COLLECTOR COMPARATOR LMV393IDR; MF: Texas Instruments; Value1: Dual Comparator; Value2: Vs 2.7-5.5V; SnapEDA_Link: https://www.snapeda.com/parts/LMV393IDR/Texas+Instruments/view-part/?ref=snap; Package: SOIC-8; Value: *; MP: LMV393IDR; Check_prices: https://www.snapeda.com/parts/LMV393IDR/Texas+Instruments/view-part/?ref=eda; JLCPCB Part #: C7984; LCSC Part #: C7984; Manufacturer: Texas Instruments; Manufacturer Part Number: LMV393IDR; MPN: LMV393IDR; Manu: Texas Instruments; Case: SOIC-8; Type: Comparator